# Altium schematic sheet Controller_Section.SchDoc
size A4; DocumentNumber: 7; SheetNumber: 7; SheetTotal: 9
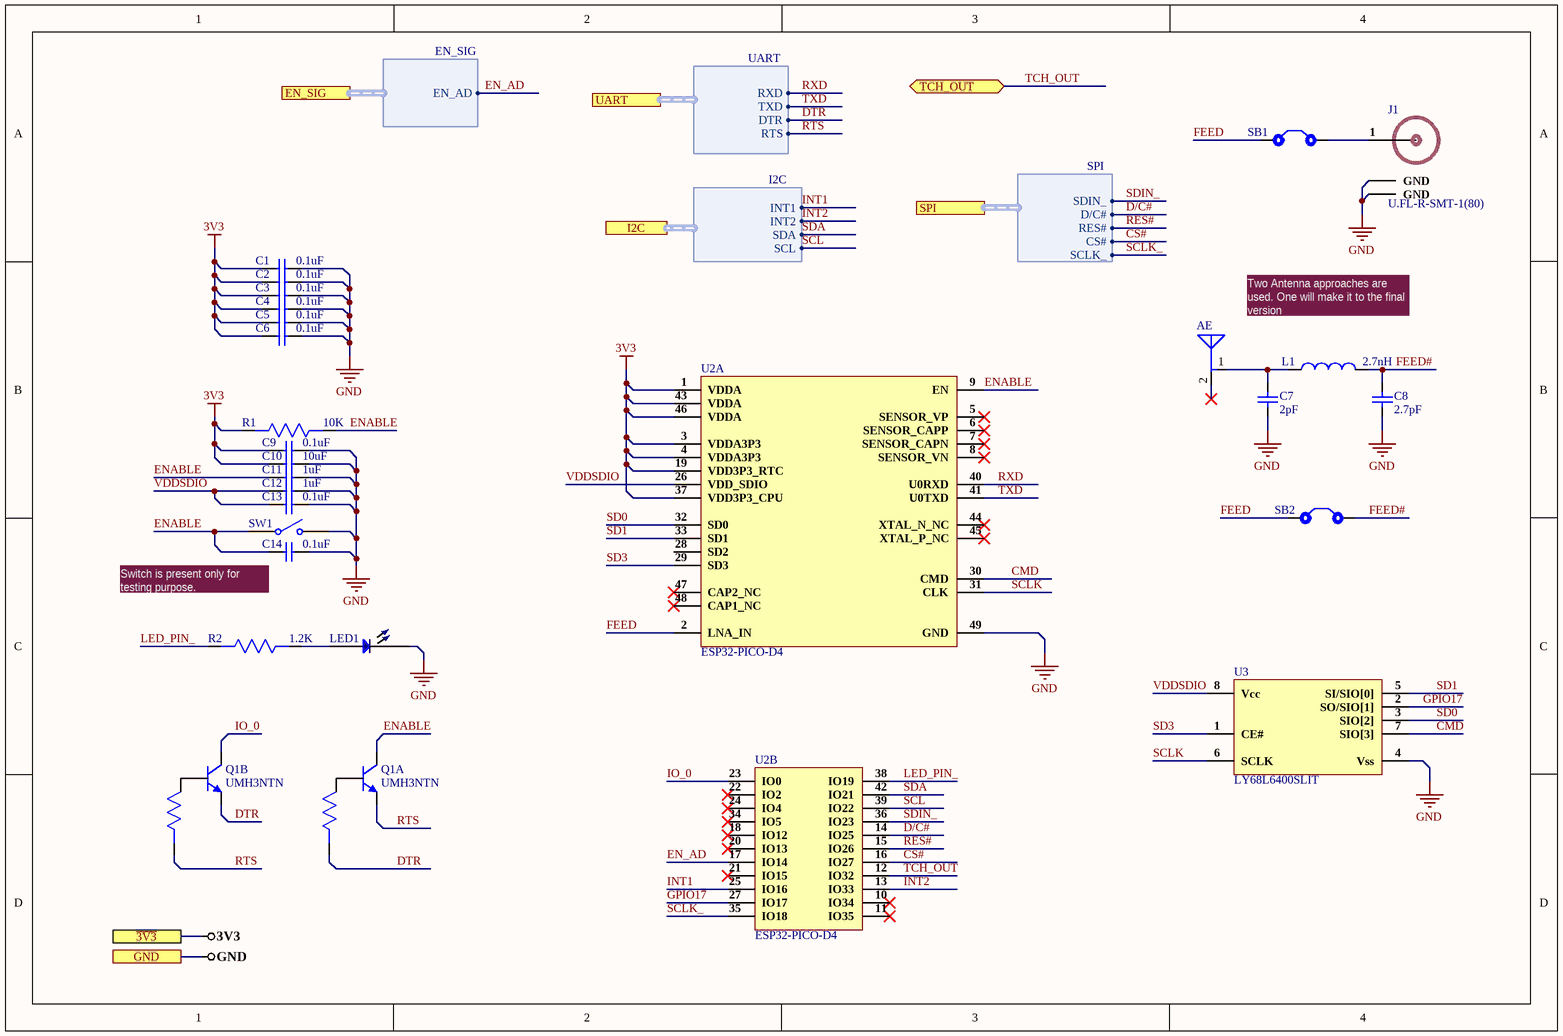
[diagram p0: Controller_Section.SchDoc]

## Parts
AE  2450AT18A100E  [2450AT18A100E]  (value not drawn)
C1  0.1uF  [CAP 0201]
C2  0.1uF  [CAP 0201]
C3  0.1uF  [CAP 0201]
C4  0.1uF  [CAP 0201]
C5  0.1uF  [CAP 0201]
C6  0.1uF  [CAP 0201]
C7  2pF  [Cap0603]
C8  2.7pF  [Cap0603]
C9  0.1uF  [CAP 0201]
C10  10uF  [Cap 0402]
C11  1uF  [CAP 0201]
C12  1uF  [CAP 0201]
C13  0.1uF  [CAP 0201]
C14  0.1uF  [CAP 0201]
J1  U.FL-R-SMT-1(80)  [U.FL-R-SMT-1(80)]
L1  2.7nH  [L-15W2N7SV4E]
LED1  16-213/GHC-YR1S1/3T  [LED 0402]  (value not drawn)
Q1  UMH3NTN  [SOT-363]  (parts A,B of 2)
R1  10K  [Res-0201]
R2  1.2K  [Res-0201]
SB1  Solder Bridge  [Solder Bridge]  (value not drawn)
SB2  Solder Bridge  [Solder Bridge]  (value not drawn)
SW1  B3U-1000P  [B3U-1000P]  (value not drawn)
U2  ESP32-PICO-D4  [48-SMD Module]  (parts A,B of 2)
U3  LY68L6400SLIT  [SOP-8]

## Ports
EN_SIG (harness EN_SIG), GND, I2C (harness I2C), SPI (harness SPI), TCH_OUT (bidir), UART (harness UART), ~{3V3}

## Harnesses
UART: RXD, TXD, DTR, RTS
I2C: INT1, INT2, SDA, SCL
SPI: SDIN_, D/C#, RES#, CS#, SCLK_
EN_SIG: EN_AD

## Nets
3V3: C1.1 C2.1 C3.1 C4.1 C5.1 C6.1 C9.1 C10.1 R1.2 U2.1(VDDA) U2.3(VDDA3P3) U2.4(VDDA3P3) U2.19(VDD3P3_RTC) U2.37(VDD3P3_CPU) U2.43(VDDA) U2.46(VDDA) ; port ~{3V3}
GND: C1.2 C2.2 C3.2 C4.2 C5.2 C6.2 C7.2 C8.2 C9.2 C10.2 C11.2 C12.2 C13.2 C14.2 J1.2(GND) J1.3(GND) LED1.2 SW1.2 U2.49(GND) U3.4(Vss) ; port GND
CMD: U2.30(CMD) U3.7(SIO[3])
CS#: U2.16(IO27) ; port SPI.CS#
D/C#: U2.14(IO25) ; port SPI.D/C#
DTR: Q1.2(DTr1_B) Q1.4(DTr2_E) ; port UART.DTR
EN_AD: U2.17(IO14) ; port EN_SIG.EN_AD
ENABLE: C11.1 C14.1 Q1.6(DTr1_C) R1.1 SW1.1 U2.9(EN)
FEED: SB1.1 SB2.1 U2.2(LNA_IN)
FEED#: C8.1 L1.2 SB2.2
GPIO17: U2.27(IO17) U3.2(SO/SIO[1])
INT1: U2.25(IO16) ; port I2C.INT1
INT2: U2.13(IO33) ; port I2C.INT2
IO_0: Q1.3(DTr2_C) U2.23(IO0)
LED_PIN_: R2.2 U2.38(IO19)
RES#: U2.15(IO26) ; port SPI.RES#
RTS: Q1.1(DTr1_E) Q1.5(DTr2_B) ; port UART.RTS
RXD: U2.40(U0RXD) ; port UART.RXD
SCL: U2.39(IO22) ; port I2C.SCL
SCLK: U2.31(CLK) U3.6(SCLK)
SCLK_: U2.35(IO18) ; port SPI.SCLK_
SD0: U2.32(SD0) U3.3(SIO[2])
SD1: U2.33(SD1) U3.5(SI/SIO[0])
SD3: U2.29(SD3) U3.1(CE#)
SDA: U2.42(IO21) ; port I2C.SDA
SDIN_: U2.36(IO23) ; port SPI.SDIN_
TCH_OUT: U2.12(IO32) ; port TCH_OUT
TXD: U2.41(U0TXD) ; port UART.TXD
VDDSDIO: C12.1 C13.1 U2.26(VDD_SDIO) U3.8(Vcc)
NetAE_1: AE.1(FEED) C7.1 L1.1
NetJ1_1: J1.1(RF_IN) SB1.2
NetLED1_1: LED1.1 R2.1

Not connected (* = marked no-connect by the designer): AE 2(NC)*; U2 5(SENSOR_VP)* 6(SENSOR_CAPP)* 7(SENSOR_CAPN)* 8(SENSOR_VN)* 10(IO34)* 11(IO35)* 18(IO12)* 20(IO13)* 21(IO15)* 22(IO2)* 24(IO4)* 28(SD2) 34(IO5)* 44(XTAL_N_NC)* 45(XTAL_P_NC)* 47(CAP2_NC)* 48(CAP1_NC)*

## Notes on the sheet
- Two Antenna approaches are used. One will make it to the final version
- Switch is present only for testing purpose.

## Library data of the parts
AE = 2450AT18A100E: 2.4GHz Chip RF Antenna 2.4GHz ~ 2.5GHz 0.5dBi Solder Surface Mount; MF: Johanson Technology; Price: None; SnapEDA_Link: https://www.snapeda.com/parts/2450AT18A100E/Johanson%20Technology%20Inc./view-part/267154/?ref=snap; Package: FBGA-780 Johanson; Availability: Unavailable; Value: *; MP: 2450AT18A100E
C1-C6 C9 C13 C14 = GRM033R61E104KE14D: Multilayer Ceramic Capacitors MLCC - SMD/SMT 0201 0.1uF 25volts X5R 10%; Manufacturer: Murata; Capacitance: 100nF; Voltage Rating: 25V; Supplier 1: Mouser; Manufacturer Part Number: GRM033R61E104KE14D; RoHS: Yes; Category: Ceramic Capacitors; Stock 1: 22478; Pricing 1: 1=0.10000, 10=0.03100, 50=0.03100, 100=0.02500, 1000=0.01700, 10000=0.01400 (USD); Mount: Surface Mount; Case/Package: 0201; Case Code (Metric): 0603; Case Code (Imperial): 0201; Weight: 1.2E-05oz; Min Operating Temperature: -55°C; Max Operating Temperature: 85°C; Packaging: Tape and Reel; Tolerance: 10%; Dielectric: X5R; Termination: SMD/SMT; Resistor Type: Ceramic; Voltage Rating (DC): 25V; Package Quantity: 15000; Length: 0.024inch; Width: 0.012inch; Height: 0.3mm; Thickness: 0.013inch; Lead Free: Lead Free; RoHS Compliant: Yes; ComponentLink1URL: http://www.farnell.com/datasheets/2867843.pdf?src-supplier=Farnell; ComponentLink1Description: http://www.farnell.com/datasheets/2867843.pdf?src-supplier=Farnell; ComponentLink2URL: http://www.mouser.com/ds/2/281/c02e-2905.pdf?src-supplier=Mouser; ComponentLink2Description: http://www.mouser.com/ds/2/281/c02e-2905.pdf?src-supplier=Mouser; ComponentLink3URL: http://search.murata.co.jp/Ceramy/image/img/A01X/G101/ENG/GRM033R61E104KE14-01.pdf?src-supplier=Digi-Key; ComponentLink3Description: http://search.murata.co.jp/Ceramy/image/img/A01X/G101/ENG/GRM033R61E104KE14-01.pdf?src-supplier=Digi-Key; ComponentLink4URL: http://www.farnell.com/datasheets/2867843.pdf?src-supplier=Newark; ComponentLink4Description: http://www.farnell.com/datasheets/2867843.pdf?src-supplier=Newark; Supplier Part Number 1: 81-GRM033R61E104KE4D
C7 = CML0603C0G2R0CT50V: CAP CER 2PF 50V C0G/NP0 0603; Manufacturer: Stackpole Electronics; Supplier 1: Digi-Key; Manufacturer Part Number: CML0603C0G2R0CT50V; Stock 1: 6378; Pricing 1: 1=0.1, 10=0.061, 50=0.0332, 100=0.027, 500=0.0193, 1000=0.0152 (USD); ComponentLink1URL: http://datasheet.octopart.com/CML0603C0G2R0CT50V-Stackpole-Electronics-datasheet-141158289.pdf?src-supplier=Stackpole+Electronics; ComponentLink1Description: http://datasheet.octopart.com/CML0603C0G2R0CT50V-Stackpole-Electronics-datasheet-141158289.pdf?src-supplier=Stackpole+Electronics; Supplier Part Number 1: 738-CML0603C0G2R0CT50VCT-ND
C8 = CML0603C0G2R7CT50V: CAP CER 2.7PF 50V C0G/NP0 0603; Manufacturer: Stackpole Electronics; Supplier 1: Digi-Key; Manufacturer Part Number: CML0603C0G2R7CT50V; Stock 1: 7780; Pricing 1: 1=0.1, 10=0.061, 50=0.0332, 100=0.027, 500=0.0193, 1000=0.0152 (USD); ComponentLink1URL: http://datasheet.octopart.com/CML0603C0G2R7CT50V-Stackpole-Electronics-datasheet-141158289.pdf?src-supplier=Stackpole+Electronics; ComponentLink1Description: http://datasheet.octopart.com/CML0603C0G2R7CT50V-Stackpole-Electronics-datasheet-141158289.pdf?src-supplier=Stackpole+Electronics; Supplier Part Number 1: 738-CML0603C0G2R7CT50VCT-ND
C10 = GRM155R61A106ME44D: 10uF ±20% 10V X5R 0402 Multilayer Ceramic Capacitors MLCC - SMD/SMT RoHS; Manufacturer: Murata Electronics; Package: 0402; Capacitance: 10uF; Tolerance: ±20%; Voltage - Rated: Voltage - Rated; Temperature Coefficient: X5R
C11 C12 = CL03A105MO3NRNC: Mlcc 0201 X5R1UF16V 20% T: 0.39MM; Manufacturer: Samsung; Supplier 1: Avnet; Manufacturer Part Number: CL03A105MO3NRNC; RoHS: Yes; Category: Ceramic Capacitors; Pricing 1: 100000=0.02840, 120000=0.02800, 220000=0.02720, 500000=0.02660, 1000000=0.02560, 5000000=0.02500, 10000000=0.02440 (USD); RoHS Compliant: Yes; Supplier Part Number 1: CL03A105MO3NRNC
J1 = U.FL-R-SMT-1(80): CONN U.FL RCPT STR 50 OHM SMD; Manufacturer: Hirose; Supplier 1: Future Electronics; Manufacturer Part Number: U.FL-R-SMT-1(80); Stock 1: 1272; Pricing 1: 1=1.07, 500=0.785, 1500=0.74, 2500=0.72, 5000=0.695 (USD); Case/Package: SMD/SMT; Package Quantity: 10000; Packaging: Tape and Reel; Lead Free: Lead Free; ComponentLink1URL: https://www.hirose.com/product/en/download_file/key_name/U.FL-R-SMT-1%2880%29/category/Specification%20Sheet/doc_file_id/37638/?file_category_id=9&item_id=03310472280&is_series=&src-supplier=Digi-Key; ComponentLink1Description: https://www.hirose.com/product/en/download_file/key_name/U.FL-R-SMT-1%2880%29/category/Specification%20Sheet/doc_file_id/37638/?file_category_id=9&item_id=03310472280&is_series=&src-supplier=Digi-Key; ComponentLink2URL: http://www.mouser.com/ds/2/185/U.FL_catalog-939761.pdf?src-supplier=Mouser; ComponentLink2Description: http://www.mouser.com/ds/2/185/U.FL_catalog-939761.pdf?src-supplier=Mouser; Supplier Part Number 1: U.FL-R-SMT-1(80)-CUTT
L1 = L-15W2N7SV4E: FIXED IND 2.7NH 800MA 80MOHM SMD; Manufacturer: Johanson; Core Material: Ceramic; Shielding: Unshielded; DC Resistance (DCR): 80mR; Self Resonant Frequency: 6GHz; Test Frequency: 250MHz; Q Factor: 60; ComponentLink1URL: http://www.mouser.com/ds/2/281/c51e-794816.pdf?src-supplier=Mouser; ComponentLink1Description: http://www.mouser.com/ds/2/281/c51e-794816.pdf?src-supplier=Mouser; ComponentLink2URL: http://search.murata.co.jp/Ceramy/image/img/PDF/ENG/L0075S0084LQP03TN_02.pdf?src-supplier=Future+Electronics; ComponentLink2Description: http://search.murata.co.jp/Ceramy/image/img/PDF/ENG/L0075S0084LQP03TN_02.pdf?src-supplier=Future+Electronics; Supplier 1: Digi-Key; Manufacturer Part Number: L-15W2N7SV4E; Stock 1: 0; Pricing 1: 4000=0.0813 (USD); Mount: Surface Mount; Case/Package: 0805; Case Code (Metric): 2012; Case Code (Imperial): 0805; Weight: 0.000194oz; Min Operating Temperature: -40°C; Max Operating Temperature: 125°C; Package Quantity: 2000; Current Rating: 800mA; Packaging: Tape and Reel; Resistor Type: Wirewound; Inductance: 2.7nH; Max DC Current: 800mA; Termination: SMD/SMT; DC Current: 800mA; Series: -; Length: 0.079inch; Width: 0.049inch; Height: 1.2mm; Height - Seated (Max): 0.055inch; Depth: 1.45mm; Military Standard: Not; RoHS Compliant: Yes; ComponentLink3URL: http://www.mouser.com/ds/2/611/jti-cat-ww-ind-541413.pdf?src-supplier=Mouser; ComponentLink3Description: http://www.mouser.com/ds/2/611/jti-cat-ww-ind-541413.pdf?src-supplier=Mouser; ComponentLink4URL: http://components.arrow.com/part/dataview/43911991S9161110N2069?src-supplier=Arrow+Electronics; ComponentLink4Description: http://components.arrow.com/part/dataview/43911991S9161110N2069?src-supplier=Arrow+Electronics; ComponentLink5URL: https://www.johansontechnology.com/downloads/johanson-technology-rf-wirewound-chip-inductors.pdf?src-supplier=Digi-Key; ComponentLink5Description: https://www.johansontechnology.com/downloads/johanson-technology-rf-wirewound-chip-inductors.pdf?src-supplier=Digi-Key; Supplier Part Number 1: L-15W2N7SV4E-ND
LED1 = 16-213/GHC-YR1S1/3T: Green 520~535nm 0402 Light Emitting Diodes (LED) RoHS; Manufacturer: Everlight Elec; Luminous Intensity (IF=20mA): 112~285mcd; Package: 0402; Illumination Color: Green; Dominant Wavelength / Coordinate rank: 520~535nm; Mounting Type: Surface Mount
Q1 = UMH3NTN: TRANS 2NPN PREBIAS 0.15W UMT6; Manufacturer: Rohm; Collector Emitter Voltage (VCEO): 50V; Emitter Base Voltage (VEBO): 5V; Max Collector Current: 100mA; Element Configuration: Dual; hFE Min: 100; Polarity: NPN; Power Dissipation: 150mW; Transition Frequency: 250MHz; Supplier 1: Digi-Key; Manufacturer Part Number: UMH3NTN; Stock 1: 12797; Pricing 1: 1=0.39, 10=0.293, 25=0.264, 100=0.1392, 500=0.12336, 1000=0.096 (USD); Mount: Surface Mount; Case/Package: SOT-363; Number of Pins: 6; Min Operating Temperature: -55°C; Max Operating Temperature: 150°C; Max Output Current: 100mA; Operating Supply Voltage: 50V; Packaging: Tape and Reel; Package Quantity: 1; Continuous Collector Current: 100mA; Collector Emitter Breakdown Voltage: 50V; Max Power Dissipation: 150mW; Max Breakdown Voltage: 50V; Voltage Rating (DC): 50V; Current Rating: 100mA; Collector Base Voltage (VCBO): 50V; Radiation Hardening: No; REACH SVHC: No SVHC; Lead Free: Lead Free; ComponentLink1URL: http://www.farnell.com/datasheets/1645293.pdf?src-supplier=Element14; ComponentLink1Description: http://www.farnell.com/datasheets/1645293.pdf?src-supplier=Element14; ComponentLink2URL: http://rohmfs.rohm.com/en/products/databook/datasheet/discrete/transistor/digital/emh3t2r-e.pdf?src-supplier=Digi-Key; ComponentLink2Description: http://rohmfs.rohm.com/en/products/databook/datasheet/discrete/transistor/digital/emh3t2r-e.pdf?src-supplier=Digi-Key; ComponentLink3URL: http://rohmfs.rohm.com/en/techdata_basic/transistor/taping/UMT6_TN_taping.pdf?src-supplier=Digi-Key; ComponentLink3Description: http://rohmfs.rohm.com/en/techdata_basic/transistor/taping/UMT6_TN_taping.pdf?src-supplier=Digi-Key; ComponentLink4URL: http://www.produktinfo.conrad.com/datenblaetter/125000-149999/140593-da-01-en-TRANSISTOR_UMH3_NTN_SOT_363.pdf?src-supplier=Conrad; ComponentLink4Description: http://www.produktinfo.conrad.com/datenblaetter/125000-149999/140593-da-01-en-TRANSISTOR_UMH3_NTN_SOT_363.pdf?src-supplier=Conrad; Supplier Part Number 1: UMH3NTNCT-ND
R1 = CR0201F10K0Q15Z: 10kΩ ±1% 1/20W ±200ppm/℃ 0201 Chip Resistor - Surface Mount RoHS; Manufacturer: Ever Ohms Tech; Package: 0201; Resistance: 10kΩ; Tolerance: ±1%; Power(Watts): 1/20W; Temperature Coefficient: ±200ppm/℃
R2 = AC0201JR-071K2L: Chip Resistor Automotive Grade Thick Film 0201 1.2kOhm 5% Paper T/R; Manufacturer: Yageo; Resistance: 1.2kR; Max Power Dissipation: 50mW; Temperature Coefficient: 200ppm/°C; Supplier 1: Avnet; Manufacturer Part Number: AC0201JR-071K2L; RoHS: Yes; Category: Chip SMD Resistors; Pricing 1: 10000=0.00143, 20000=0.00141, 40000=0.00137, 60000=0.00134, 80000=0.00129, 100000=0.00126, 1000000=0.00123 (USD); Case/Package: 0201; Min Operating Temperature: -55°C; Max Operating Temperature: 155°C; Packaging: Tape and Reel; Resistor Type: Thick Film; Number of Terminations: 2; Tolerance: 5%; Features: Moisture Resistant,Automotive AEC-Q200; Length: 0.024inch; Width: 0.012inch; Height: 0.01inch; RoHS Compliant: Yes; ComponentLink1URL: http://www.yageo.com/NewPortal/yageodocoutput?fileName=/pdf/R-Chip/PYu-AC_51_RoHS_L_6.pdf&src-supplier=Digi-Key; ComponentLink1Description: http://www.yageo.com/NewPortal/yageodocoutput?fileName=/pdf/R-Chip/PYu-AC_51_RoHS_L_6.pdf&src-supplier=Digi-Key; Supplier Part Number 1: AC0201JR-071K2L
SB1 SB2 = Solder Bridge: Solder Bridge ON
SW1 = B3U-1000P: SWITCH TACTILE SPST-NO 0.05A 12V; Manufacturer: Omron; Mechanical Life: 200000Cycles; Operating Force: 1.5N; Throw Configuration: SPST; Current Rating: 50mA; Contact Resistance: 100mR; Illumination Type: Non-Illuminated,Illuminated; Switch Travel: 0.15mm; Switch Function: Off-Mom; Actuator Type: Standard; Actuator Length: 0.4mm; Ratings: Dust Proof,IP40; ComponentLink1URL: http://www.farnell.com/datasheets/60838.pdf?src-supplier=Farnell; ComponentLink1Description: http://www.farnell.com/datasheets/60838.pdf?src-supplier=Farnell; ComponentLink2URL: http://www.farnell.com/datasheets/60838.pdf?src-supplier=Element14; ComponentLink2Description: http://www.farnell.com/datasheets/60838.pdf?src-supplier=Element14; ComponentLink3URL: https://omronfs.omron.com/en_US/ecb/products/pdf/en-b3u.pdf?src-supplier=Digi-Key; ComponentLink3Description: https://omronfs.omron.com/en_US/ecb/products/pdf/en-b3u.pdf?src-supplier=Digi-Key; ComponentLink4URL: http://www.omron.com/ecb/products/pdf/en-b3u.pdf?src-supplier=Digi-Key; ComponentLink4Description: http://www.omron.com/ecb/products/pdf/en-b3u.pdf?src-supplier=Digi-Key; ComponentLink5URL: https://www.distrelec.biz/Web/Downloads/he/et/B3U_eng_datasheet.pdf?mime=application%2Fpdf&src-supplier=Distrelec; ComponentLink5Description: https://www.distrelec.biz/Web/Downloads/he/et/B3U_eng_datasheet.pdf?mime=application%2Fpdf&src-supplier=Distrelec; ComponentLink6URL: http://www.onlinecomponents.com/productFiles/mf-OM/en-b3u.pdf?src-supplier=Onlinecomponents.com; ComponentLink6Description: http://www.onlinecomponents.com/productFiles/mf-OM/en-b3u.pdf?src-supplier=Onlinecomponents.com; Supplier 1: Digi-Key; Manufacturer Part Number: B3U-1000P; Stock 1: 116454; Pricing 1: 1=1, 10=0.961, 25=0.9064, 50=0.7976, 100=0.7251, 250=0.68888, 500=0.67074, 1000=0.52571 (USD); Mount: Surface Mount; Weight: 0.000776oz; Contact Material: Silver; Min Operating Temperature: -25°C; Max Operating Temperature: 70°C; Packaging: Tape and Reel; Voltage Rating (DC): 12V; Package Quantity: 1; Max Current Rating: 50mA; Termination: SMD/SMT; Orientation: Straight; Max Voltage Rating (DC): 12V; Electrical Life: 200000Cycles; Insulation Resistance: 100MR; Contact Current Rating: 50mA; Length: 4mm; Height: 1.2mm; Depth: 2.5mm; Width: 3mm; REACH SVHC: Unknown; Lead Free: Lead Free; ComponentLink7URL: https://www.verical.com/server-webapp/html/getDatasheet?partID=552554&src-supplier=Verical; ComponentLink7Description: https://www.verical.com/server-webapp/html/getDatasheet?partID=552554&src-supplier=Verical; ComponentLink8URL: http://www.farnell.com/datasheets/1685550.pdf?src-supplier=Element14; ComponentLink8Description: http://www.farnell.com/datasheets/1685550.pdf?src-supplier=Element14; ComponentLink9URL: http://www.farnell.com/datasheets/2610940.pdf?src-supplier=Farnell; ComponentLink9Description: http://www.farnell.com/datasheets/2610940.pdf?src-supplier=Farnell; ComponentLink10URL: https://www.alliedelec.com/m/d/4c8a9ef82804fc3c241a13c1e298fd73.pdf?src-supplier=Allied+Electronics; ComponentLink10Description: https://www.alliedelec.com/m/d/4c8a9ef82804fc3c241a13c1e298fd73.pdf?src-supplier=Allied+Electronics; Supplier Part Number 1: SW1020DKR-ND
U2 = ESP32-PICO-D4: RX TXRX MOD WIFI SURFACE MOUNT; Manufacturer: Espressif Systems; Frequency: 2.5GHz; Interface: I2C,SPI,GPIO,PWM,SDIO,UART; Data Rate: 150Mbps; Sensitivity: -98.4dBm; Memory Size: 4MB; Supplier 1: Digi-Key; Manufacturer Part Number: ESP32-PICO-D4; Stock 1: 5967; Pricing 1: 1=4.5 (USD); Mount: Surface Mount; Case/Package: SMD/SMT; Min Operating Temperature: -40°C; Max Operating Temperature: 85°C; ComponentLink1URL: https://www.espressif.com/sites/default/files/documentation/esp32-pico-d4_datasheet_en.pdf?src-supplier=Digi-Key; ComponentLink1Description: https://www.espressif.com/sites/default/files/documentation/esp32-pico-d4_datasheet_en.pdf?src-supplier=Digi-Key; Supplier Part Number 1: 1904-1029-1-ND
U3 = LY68L6400SLIT: Volatile 64Mb (8M x 8) SPI/ QPI 2.7V ~ 3.6V SOP-8_150mil RAM RoHS; Manufacturer: Lyontek Inc.; Value: Custom; Manufacturer Part No: LY68L6400SLIT; Package: SOP-8